# Altium schematic sheet signal-light-2.SchDoc
size A4; SheetNumber: 5; SheetTotal: 21
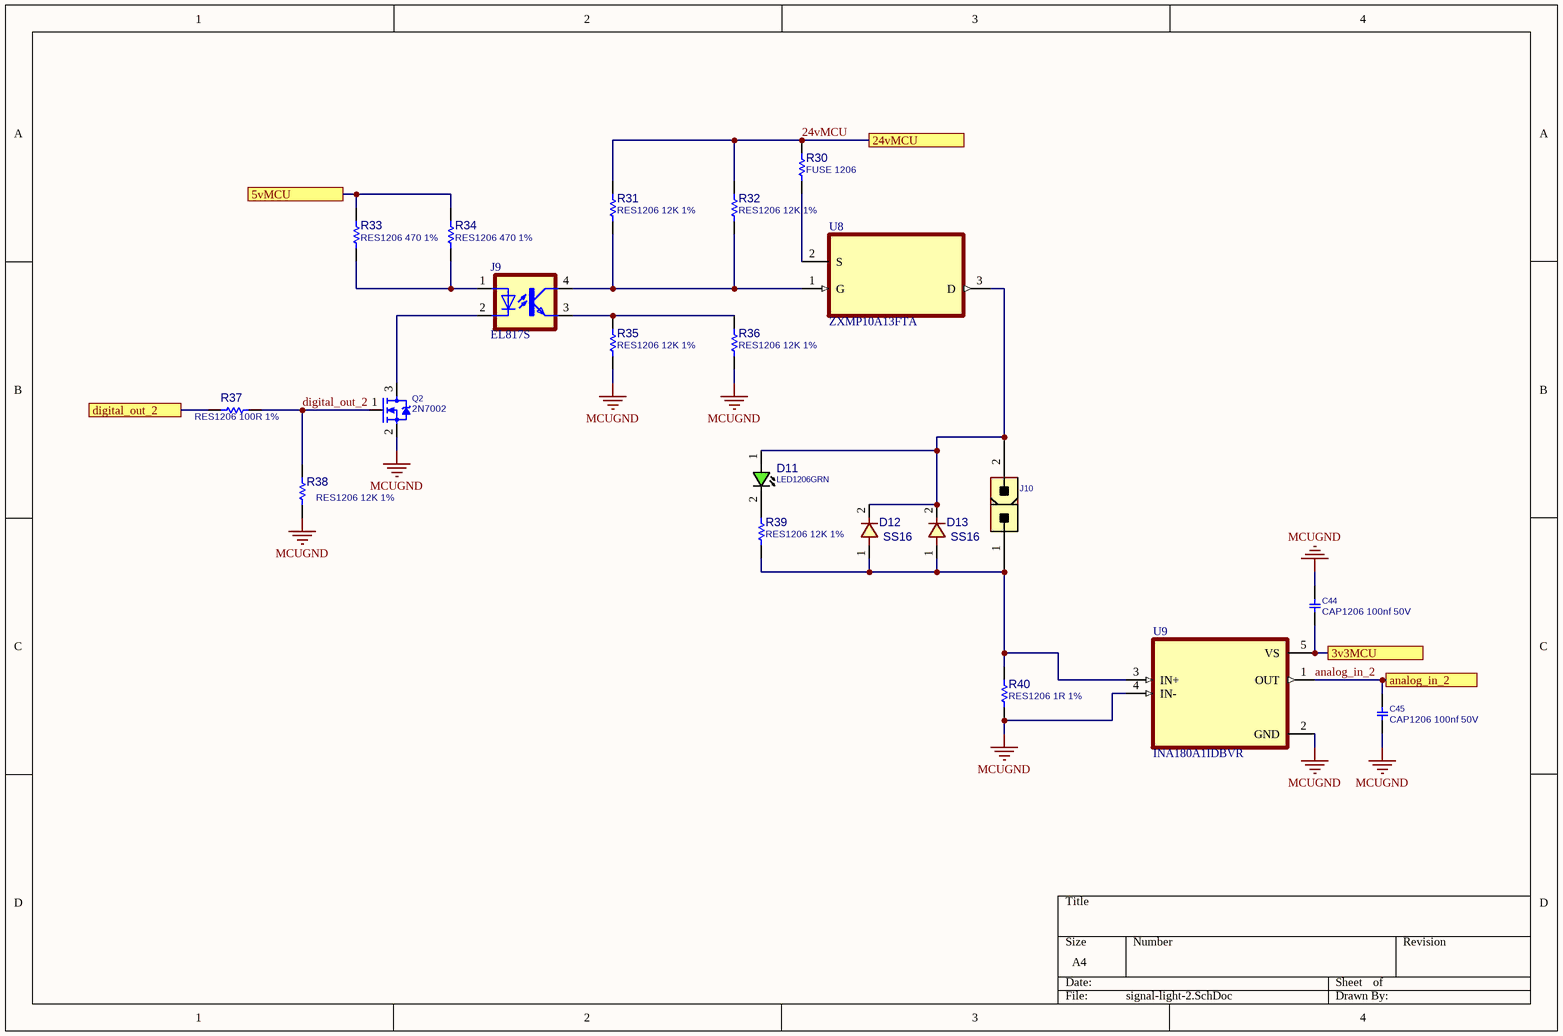
[diagram p0: signal-light-2.SchDoc]

## Parts
C44  CAP1206 100nf 50V  [C1206]
C45  CAP1206 100nf 50V  [C1206]
D11  LED1206GRN  [LED1206GRN]
D12  SS16  [D_SMA]
D13  SS16  [D_SMA]
J9  EL817S  [SOIC254P1030X460-4N]
J10  CONN_ATXPWR_2  [ATXPWR_2]  (value not drawn)
Q2  2N7002  [SOT23_3]
R30  FUSE 1206  [R1206]
R31  RES1206 12K 1%  [R1206]
R32  RES1206 12K 1%  [R1206]
R33  RES1206 470 1%  [R1206]
R34  RES1206 470 1%  [R1206]
R35  RES1206 12K 1%  [R1206]
R36  RES1206 12K 1%  [R1206]
R37  RES1206 100R 1%  [R1206]
R38  RES1206 12K 1%  [R1206]
R39  RES1206 12K 1%  [R1206]
R40  RES1206 1R 1%  [R1206]
U8  ZXMP10A13FTA  [SOT95P230X110-3N]
U9  INA180A1IDBVR  [SOT95P280X145-5N]

## Ports
3v3MCU, 5vMCU, 24vMCU, analog_in_2, digital_out_2

## Nets
MCUGND: C44.1 C45.2 Q2.2(SOURCE) R35.2 R36.2 R38.2 R40.2 U9.2(GND) U9.4(IN-)
3v3MCU: C44.2 U9.5(VS) ; port 3v3MCU
5vMCU: R33.2 R34.2 ; port 5vMCU
24vMCU: R30.1 R31.1 R32.1 ; port 24vMCU
analog_in_2: C45.1 U9.1(OUT) ; port analog_in_2
digital_out_2: Q2.1(GATE) R37.2 R38.1
digital_out_2: R37.1 ; port digital_out_2  [a separate net that carries the same name]
NetD11_1: D11.1(ANODE) D12.2 D13.2 J10.2 U8.3(D)
NetD11_2: D11.2(CATHODE) R39.1
NetD12_1: D12.1 D13.1 J10.1 R39.2 R40.1 U9.3(IN+)
NetJ9_1: J9.1(A) R33.1 R34.1
NetJ9_2: J9.2(C) Q2.3(DRAIN)
NetJ9_3: J9.3(EMIT) R35.1 R36.1
NetJ9_4: J9.4(COL) R31.2 R32.2 U8.1(G)
NetR30_2: R30.2 U8.2(S)

## Library data of the parts
C44 C45 = CAP_SMD_MLCC_1206: CAP, MLCC; PARAM: -, -%; MANF_P#: MANF_PART#; PARAM2: -V; PRICE: 100= 1$; MANF: -; ASSEMBLY: ASSEMBLY
D11 = LED_SMD_1206_GRN: LED, SMD, 1206, GREEN; PARAM: 20mA; DESC: DESCRIPTION; PARAM2: 2.2V; MANF: -; ASSEMBLY: ASSEMBLY; PRICE: 36t@Javan; MANF_P#: -; VALUE: LED1206GRN; MountType: SMT; PartType: LED
D12 D13 = DIODE_SMD_1N4001: DIODE, GENERAL PURPOSE, 50V/1A; DESC: DESCRIPTION; PARAM: 50V VRRM; PARAM2: 1A; MANF_P#: 1N4001; MANF: MANF; ASSEMBLY: ASSEMBLY; PRICE: PRICE; VALUE: SS16
J9 = EL817S: Optoisolator Transistor Output 5000Vrms 1 Channel 4-SMD; MF: Everlight Electronics; SnapEDA_Link: https://www.snapeda.com/parts/EL817S/Everlight+Electronics+Co+Ltd/view-part/?ref=snap; Package: SMD-4 Everlight Electronics Co Ltd; Value: *; MP: EL817S; Check_prices: https://www.snapeda.com/parts/EL817S/Everlight+Electronics+Co+Ltd/view-part/?ref=eda
J10 = CONN_ATXPWR_2: CONN, ATX POWER, 2 P; MANF: Molex; MANF_P#: 39281023; VALUE: CONN_ATXPWR_2; MountType: THD; PACKAGE: ATXPWR-2pin; Part Type: Conn.
Q2 = MOSN_2N7002_SOT23: MOSFET, N-CH, 60V, 0.3A; MANF: NXP; ASSEMBLY: ASSEMBLY; MANF_P#: 2N7002; PARAM2: 60v; PARAM: 0.3A; PRICE: 0.3t@Javan; VALUE: 2N7002
R30-R40 = RES_SMD_1206: RESISTOR, SMD; PARAM: 1%, 0.25W; DESC: DESCRIPTION; DIST#: MOUSER; MANF_P#: -; MANF: -; ASSEMBLY: ASSEMBLY; PRICE: -; PARAM2: -
U8 = ZXMP10A13FTA: P-Channel 100 V 600mA (Ta) 625mW (Ta) Surface Mount SOT-23-3; MF: Diodes Inc.; Purchase-URL: https://pricing.snapeda.com/search/part/ZXMP10A13FTA/?ref=eda; Package: SOT-23-3 Diodes Inc.; SnapEDA_Link: https://www.snapeda.com/parts/ZXMP10A13FTA/Diodes+Inc./view-part/?ref=snap; Availability: In Stock; Value: *; MP: ZXMP10A13FTA; Check_prices: https://www.snapeda.com/parts/ZXMP10A13FTA/Diodes+Inc./view-part/?ref=eda; Price: None
U9 = INA180A1IDBVR: 26V, 350kHz current sense amplifier; MF: Texas Instruments; SnapEDA_Link: https://www.snapeda.com/parts/INA180A1IDBVR/Texas+Instruments/view-part/?ref=snap; Package: SOT-23-5 Texas Instruments; Value: *; MP: INA180A1IDBVR; Check_prices: https://www.snapeda.com/parts/INA180A1IDBVR/Texas+Instruments/view-part/?ref=eda